# Altium project Baseboard-v2.1.PrjPcb (part 1 of 6)
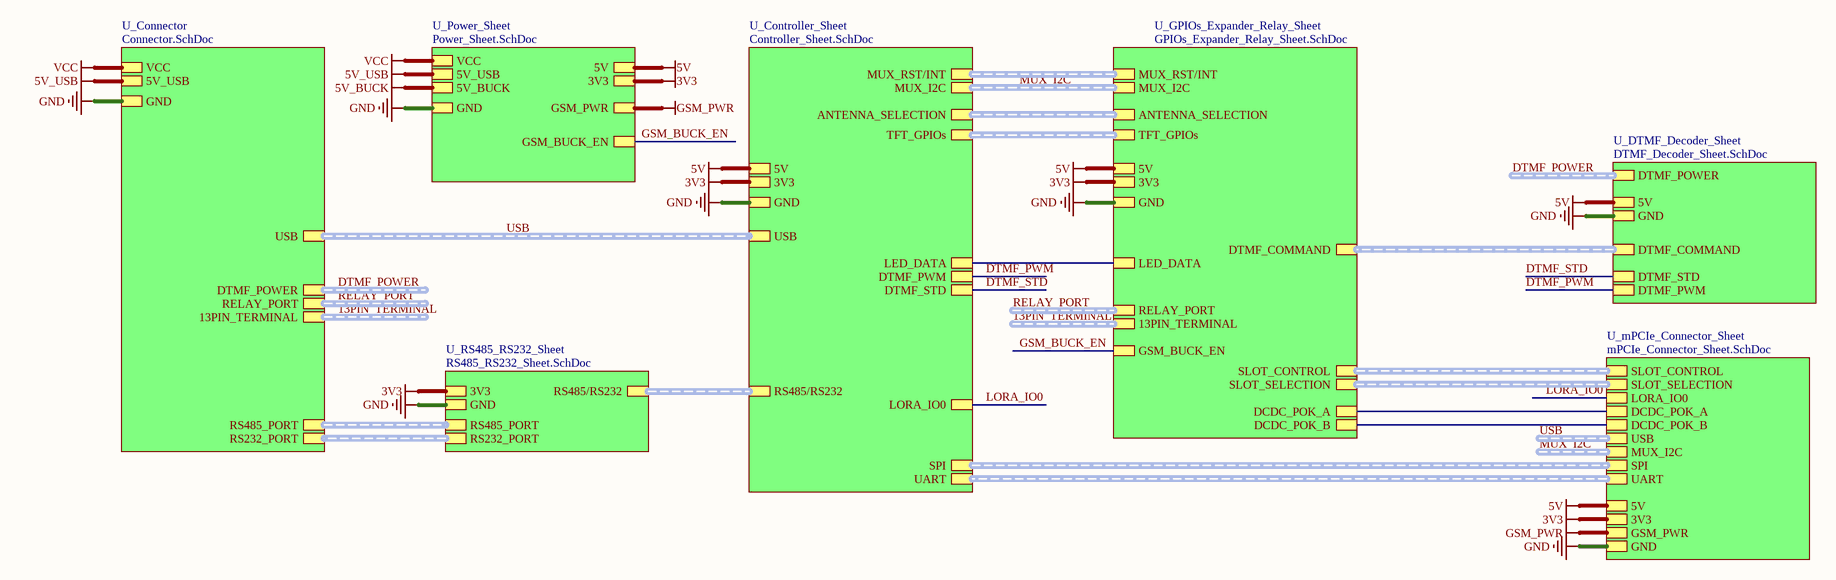
[diagram p0: Top_Sheet.SchDoc]
8 sheets, 216 parts. Net scope: hierarchical (ports join the sheet entries above them; power ports are global).
Board file: Baseboard-v2.0.PcbDoc
Sheets:
  Top_Sheet.SchDoc
    U_Connector = Connector.SchDoc
    U_Power_Sheet = Power_Sheet.SchDoc
    U_DTMF_Decoder_Sheet = DTMF_Decoder_Sheet.SchDoc
    U_RS485_RS232_Sheet = RS485_RS232_Sheet.SchDoc
    U_mPCIe_Connector_Sheet = mPCIe_Connector_Sheet.SchDoc
    U_Controller_Sheet = Controller_Sheet.SchDoc
    U_GPIOs_Expander_Relay_Sheet = GPIOs_Expander_Relay_Sheet.SchDoc

## Sheet Top_Sheet.SchDoc
size 420 x 297 mm; SheetNumber: 1; SheetTotal: 8

### Sub-sheets
U_Connector = Connector.SchDoc: VCC, GND, 5V_USB, RS485_PORT (harness RS485_PORT), DTMF_POWER (harness DTMF_POWER), RS232_PORT (harness RS232_PORT), RELAY_PORT (harness RELAY_PORT), 13PIN_TERMINAL (harness 17PIN_TERMINAL), USB (harness USB)
U_Controller_Sheet = Controller_Sheet.SchDoc: UART (harness UART), MUX_RST/INT (harness INTERRUPT), MUX_I2C (harness MUX_I2C), SPI (harness SPI), RS485/RS232 (harness RS485/RS232), USB (harness USB), DTMF_STD, GND, 5V, 3V3, ANTENNA_SELECTION (harness 17PIN_TERMINAL), LED_DATA, LORA_IO0, DTMF_PWM, TFT_GPIOs (harness 17PIN_TERMINAL)
U_DTMF_Decoder_Sheet = DTMF_Decoder_Sheet.SchDoc: DTMF_POWER (harness DTMF_POWER), 5V, GND, DTMF_COMMAND (harness DTMF_COMMAND), DTMF_STD, DTMF_PWM
U_GPIOs_Expander_Relay_Sheet = GPIOs_Expander_Relay_Sheet.SchDoc: 3V3, GND, 5V, DTMF_COMMAND (harness DTMF_COMMAND), RELAY_PORT (harness RELAY_PORT), 13PIN_TERMINAL (harness 17PIN_TERMINAL), SLOT_SELECTION (harness SLOT_SELECTION), MUX_RST/INT (harness INTERRUPT), MUX_I2C (harness MUX_I2C), DCDC_POK_A, SLOT_CONTROL (harness SLOT_CONTROL), ANTENNA_SELECTION (harness 17PIN_TERMINAL), LED_DATA, GSM_BUCK_EN, DCDC_POK_B, TFT_GPIOs (harness 17PIN_TERMINAL)
U_mPCIe_Connector_Sheet = mPCIe_Connector_Sheet.SchDoc: SLOT_SELECTION (harness SLOT_SELECTION), SLOT_CONTROL (harness SLOT_CONTROL), SPI (harness SPI), DCDC_POK_A, USB (harness USB), 5V, 3V3, MUX_I2C (harness MUX_I2C), GSM_PWR, GND, UART (harness UART), LORA_IO0, DCDC_POK_B
U_Power_Sheet = Power_Sheet.SchDoc: VCC, 5V_BUCK, GND, GSM_BUCK_EN, 5V_USB, GSM_PWR, 5V, 3V3
U_RS485_RS232_Sheet = RS485_RS232_Sheet.SchDoc: GND, RS485_PORT (harness RS485_PORT), RS232_PORT (harness RS232_PORT), 3V3, RS485/RS232 (harness RS485/RS232)

### Nets
3V3: sheet U_Power_Sheet/3V3, sheet U_RS485_RS232_Sheet/3V3, sheet U_mPCIe_Connector_Sheet/3V3, sheet U_Controller_Sheet/3V3, sheet U_GPIOs_Expander_Relay_Sheet/3V3
5V: sheet U_Power_Sheet/5V, sheet U_DTMF_Decoder_Sheet/5V, sheet U_mPCIe_Connector_Sheet/5V, sheet U_Controller_Sheet/5V, sheet U_GPIOs_Expander_Relay_Sheet/5V
5V_USB: sheet U_Connector/5V_USB, sheet U_Power_Sheet/5V_USB
GND: sheet U_Connector/GND, sheet U_Power_Sheet/GND, sheet U_DTMF_Decoder_Sheet/GND, sheet U_RS485_RS232_Sheet/GND, sheet U_mPCIe_Connector_Sheet/GND, sheet U_Controller_Sheet/GND, sheet U_GPIOs_Expander_Relay_Sheet/GND
GSM_PWR: sheet U_Power_Sheet/GSM_PWR, sheet U_mPCIe_Connector_Sheet/GSM_PWR
VCC: sheet U_Connector/VCC, sheet U_Power_Sheet/VCC
DCDC_POK_A: sheet U_mPCIe_Connector_Sheet/DCDC_POK_A, sheet U_GPIOs_Expander_Relay_Sheet/DCDC_POK_A
DCDC_POK_B: sheet U_mPCIe_Connector_Sheet/DCDC_POK_B, sheet U_GPIOs_Expander_Relay_Sheet/DCDC_POK_B
DTMF_PWM: sheet U_DTMF_Decoder_Sheet/DTMF_PWM, sheet U_Controller_Sheet/DTMF_PWM
DTMF_STD: sheet U_DTMF_Decoder_Sheet/DTMF_STD, sheet U_Controller_Sheet/DTMF_STD
GSM_BUCK_EN: sheet U_Power_Sheet/GSM_BUCK_EN, sheet U_GPIOs_Expander_Relay_Sheet/GSM_BUCK_EN
LED_DATA: sheet U_Controller_Sheet/LED_DATA, sheet U_GPIOs_Expander_Relay_Sheet/LED_DATA
LORA_IO0: sheet U_mPCIe_Connector_Sheet/LORA_IO0, sheet U_Controller_Sheet/LORA_IO0

### Buses and harness runs
harness 13PIN_TERMINAL = sheet U_Connector/13PIN_TERMINAL
harness 13PIN_TERMINAL = sheet U_GPIOs_Expander_Relay_Sheet/13PIN_TERMINAL
harness DTMF_POWER = sheet U_Connector/DTMF_POWER
harness DTMF_POWER = sheet U_DTMF_Decoder_Sheet/DTMF_POWER
harness MUX_I2C = sheet U_Controller_Sheet/MUX_I2C = sheet U_GPIOs_Expander_Relay_Sheet/MUX_I2C
harness MUX_I2C = sheet U_mPCIe_Connector_Sheet/MUX_I2C
harness RELAY_PORT = sheet U_Connector/RELAY_PORT
harness RELAY_PORT = sheet U_GPIOs_Expander_Relay_Sheet/RELAY_PORT
harness sheet U_Connector/RS232_PORT = sheet U_RS485_RS232_Sheet/RS232_PORT
harness sheet U_Connector/RS485_PORT = sheet U_RS485_RS232_Sheet/RS485_PORT
harness sheet U_Controller_Sheet/ANTENNA_SELECTION = sheet U_GPIOs_Expander_Relay_Sheet/ANTENNA_SELECTION
harness sheet U_Controller_Sheet/MUX_RST/INT = sheet U_GPIOs_Expander_Relay_Sheet/MUX_RST/INT
harness sheet U_Controller_Sheet/RS485/RS232 = sheet U_RS485_RS232_Sheet/RS485/RS232
harness sheet U_Controller_Sheet/SPI = sheet U_mPCIe_Connector_Sheet/SPI
harness sheet U_Controller_Sheet/TFT_GPIOs = sheet U_GPIOs_Expander_Relay_Sheet/TFT_GPIOs
harness sheet U_Controller_Sheet/UART = sheet U_mPCIe_Connector_Sheet/UART
harness sheet U_DTMF_Decoder_Sheet/DTMF_COMMAND = sheet U_GPIOs_Expander_Relay_Sheet/DTMF_COMMAND
harness sheet U_GPIOs_Expander_Relay_Sheet/SLOT_CONTROL = sheet U_mPCIe_Connector_Sheet/SLOT_CONTROL
harness sheet U_GPIOs_Expander_Relay_Sheet/SLOT_SELECTION = sheet U_mPCIe_Connector_Sheet/SLOT_SELECTION
harness USB = sheet U_Connector/USB = sheet U_Controller_Sheet/USB
harness USB = sheet U_mPCIe_Connector_Sheet/USB

### Notes on the sheet
- File:
- Title:
- Date:
- Page
- Num:
- Total:
- Drawn By: Huzaifa Ali

## Sheet Connector.SchDoc
size A4; SheetNumber: 2; SheetTotal: 8
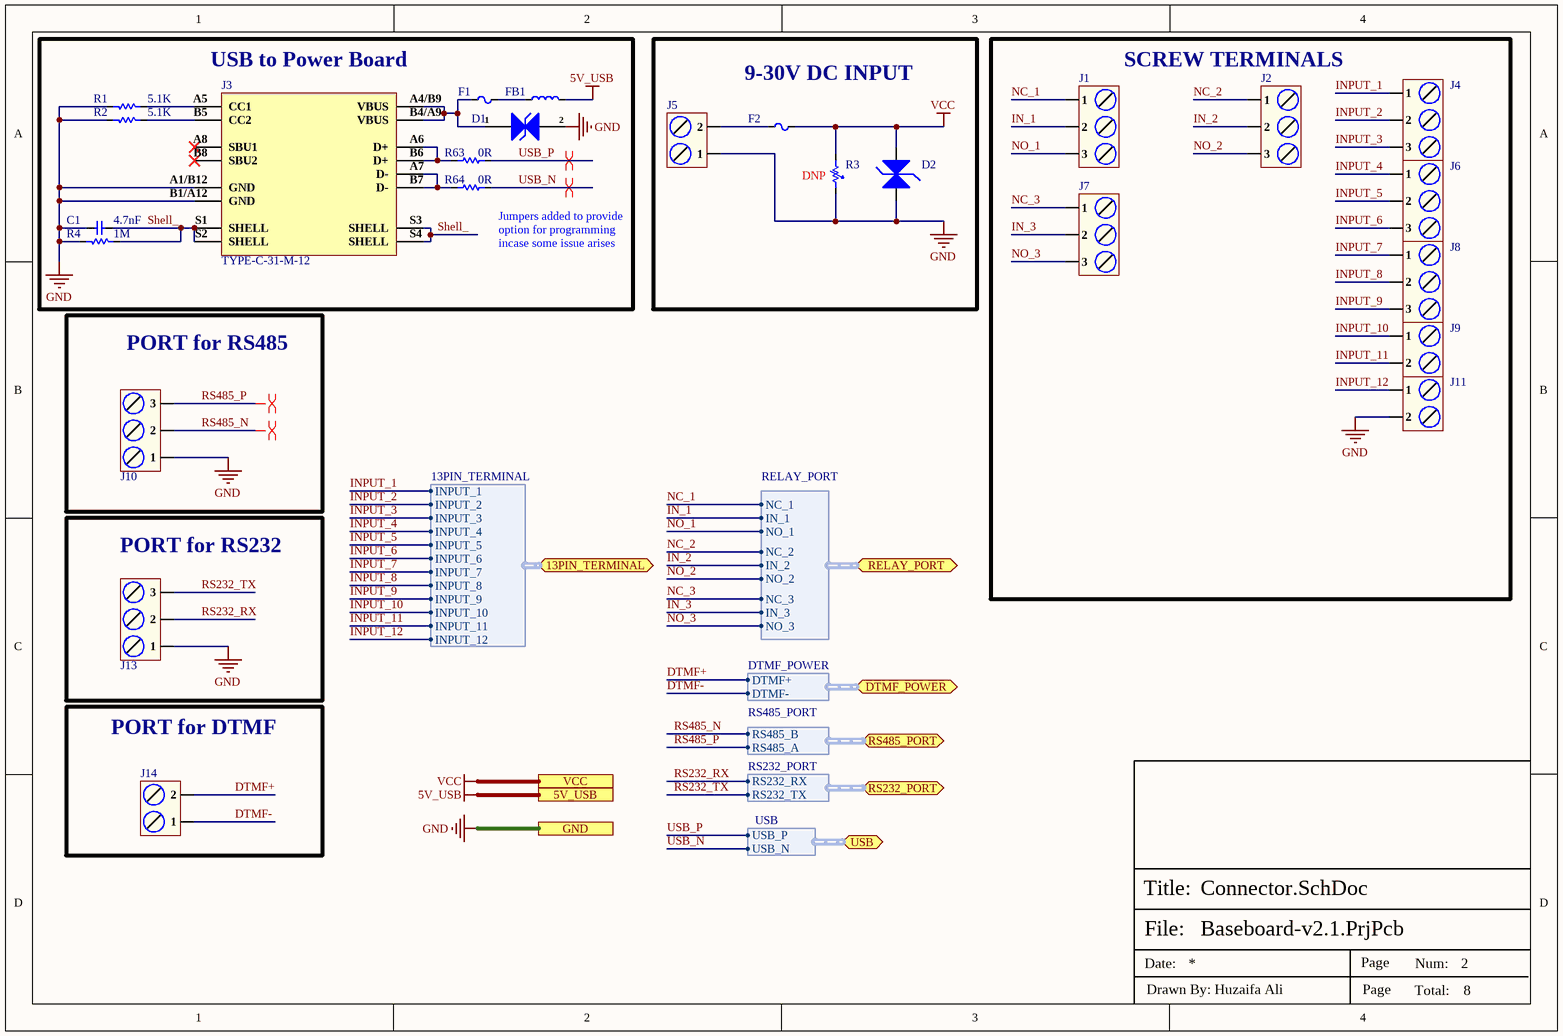
[diagram p1: Connector.SchDoc]

### Parts
C1  4.7nF  [Cap-0603]
D1  PESD5V0H1BSFYL  [DSN0603-2]  (value not drawn)
D2  SMBJ36CA  [SMB_]  (value not drawn)
F1  1206L300SLTHYR  [Fuse 1206 (3216 Metric)]  (value not drawn)
F2  SHV2920P500-30-AA  [Fuse-2920]  (value not drawn)
FB1  100MHz  [IND-1206]  (value not drawn)
J1  DB128L-5.08-3P-BK-S  [DB128L-5.08-3P-BK-S]  (value not drawn)
J2  DB128L-5.08-3P-BK-S  [DB128L-5.08-3P-BK-S]  (value not drawn)
J3  TYPE-C-31-M-12  [TYPE-C-31-M-12_]
J4  DB128L-5.08-3P-BK-S  [DB128L-5.08-3P-BK-S]  (value not drawn)
J5  DB128L-5.08-2P-BK-S  [DB128L-5.08-2P-BK-S]  (value not drawn)
J6  DB128L-5.08-3P-BK-S  [DB128L-5.08-3P-BK-S]  (value not drawn)
J7  DB128L-5.08-3P-BK-S  [DB128L-5.08-3P-BK-S]  (value not drawn)
J8  DB128L-5.08-3P-BK-S  [DB128L-5.08-3P-BK-S]  (value not drawn)
J9  DB128L-5.08-2P-BK-S  [DB128L-5.08-2P-BK-S]  (value not drawn)
J10  DB128L-5.08-3P-BK-S  [DB128L-5.08-3P-BK-S]  (value not drawn)
J11  DB128L-5.08-2P-BK-S  [DB128L-5.08-2P-BK-S]  (value not drawn)
J13  DB128L-5.08-3P-BK-S  [DB128L-5.08-3P-BK-S]  (value not drawn)
J14  DB128L-5.08-2P-BK-S  [DB128L-5.08-2P-BK-S]  (value not drawn)
R1  5.1K  [Res-0402]
R2  5.1K  [Res-0402]
R3  B72210S0300K101  [B72210S0300K101]  (value not drawn)
R4  1M  [Res-0402]
R63  0R  [Res-0402]
R64  0R  [Res-0402]

### Blocks framed on the sheet
USB to Power Board: C1 D1 F1 FB1 J3 R1 R2 R4 R63 R64
9-30V DC INPUT: D2 F2 J5 R3
SCREW TERMINALS: J1 J2 J4 J6-J9 J11
PORT for RS485: J10
PORT for RS232: J13
PORT for DTMF: J14

### Ports
5V_USB, 13PIN_TERMINAL (bidir, harness 13PIN_TERMINAL), DTMF_POWER (bidir, harness DTMF_POWER), GND, RELAY_PORT (bidir, harness RELAY_PORT), RS232_PORT (bidir, harness RS232_PORT), RS485_PORT (bidir, harness RS485_PORT), USB (bidir, harness USB), VCC

### Harnesses
RS485_PORT: RS485_B, RS485_A
DTMF_POWER: DTMF+, DTMF-
RS232_PORT: RS232_RX, RS232_TX
RELAY_PORT: NC_1, NC_2, IN_1, IN_2, NO_1, NO_2, NC_3, IN_3, NO_3
USB: USB_P, USB_N
13PIN_TERMINAL: INPUT_7, INPUT_1, INPUT_2, INPUT_8, INPUT_3, INPUT_9, INPUT_4, INPUT_10, INPUT_5, INPUT_11, INPUT_6, INPUT_12

### Nets
5V_USB: FB1.2 ; port 5V_USB
GND: C1.1 D1.2 D2.1(A) J3.A1/B12(GND) J3.B1/A12(GND) J5.1 J10.1 J11.2 J13.1 R1.2 R2.2 R3.2 R4.2 ; port GND
VCC: D2.2(A) F2.2 R3.1 ; port VCC
DTMF+: J14.2 ; port DTMF_POWER.DTMF+
DTMF-: J14.1 ; port DTMF_POWER.DTMF-
IN_1: J1.2 ; port RELAY_PORT.IN_1
IN_2: J2.2 ; port RELAY_PORT.IN_2
IN_3: J7.2 ; port RELAY_PORT.IN_3
INPUT_1: J4.1 ; port 13PIN_TERMINAL.INPUT_1  [project net 13PIN_TERMINAL.INPUT_1]
INPUT_2: J4.2 ; port 13PIN_TERMINAL.INPUT_2  [project net 13PIN_TERMINAL.INPUT_2]
INPUT_3: J4.3 ; port 13PIN_TERMINAL.INPUT_3  [project net 13PIN_TERMINAL.INPUT_3]
INPUT_4: J6.1 ; port 13PIN_TERMINAL.INPUT_4  [project net 13PIN_TERMINAL.INPUT_4]
INPUT_5: J6.2 ; port 13PIN_TERMINAL.INPUT_5  [project net 13PIN_TERMINAL.INPUT_5]
INPUT_6: J6.3 ; port 13PIN_TERMINAL.INPUT_6  [project net 13PIN_TERMINAL.INPUT_6]
INPUT_7: J8.1 ; port 13PIN_TERMINAL.INPUT_7  [project net 13PIN_TERMINAL.INPUT_7]
INPUT_8: J8.2 ; port 13PIN_TERMINAL.INPUT_8  [project net 13PIN_TERMINAL.INPUT_8]
INPUT_9: J8.3 ; port 13PIN_TERMINAL.INPUT_9  [project net 13PIN_TERMINAL.INPUT_9]
INPUT_10: J9.1 ; port 13PIN_TERMINAL.INPUT_10  [project net 13PIN_TERMINAL.INPUT_10]
INPUT_11: J9.2 ; port 13PIN_TERMINAL.INPUT_11  [project net 13PIN_TERMINAL.INPUT_11]
INPUT_12: J11.1 ; port 13PIN_TERMINAL.INPUT_12  [project net 13PIN_TERMINAL.INPUT_12]
NC_1: J1.1 ; port RELAY_PORT.NC_1
NC_2: J2.1 ; port RELAY_PORT.NC_2
NC_3: J7.1 ; port RELAY_PORT.NC_3
NO_1: J1.3 ; port RELAY_PORT.NO_1
NO_2: J2.3 ; port RELAY_PORT.NO_2
NO_3: J7.3 ; port RELAY_PORT.NO_3
RS232_RX: J13.2 ; port RS232_PORT.RS232_RX
RS232_TX: J13.3 ; port RS232_PORT.RS232_TX
RS485_N: J10.2 ; port RS485_PORT.RS485_B
RS485_P: J10.3 ; port RS485_PORT.RS485_A
Shell_: C1.2 J3.S1(SHELL) J3.S2(SHELL) J3.S3(SHELL) J3.S4(SHELL) R4.1
USB_N: R64.2 ; port USB.USB_N  [project net USB.USB_N]
USB_P: R63.2 ; port USB.USB_P  [project net USB.USB_P]
NetD1_1: D1.1 F1.1 J3.A4/B9(VBUS) J3.B4/A9(VBUS)
NetF1_2: F1.2 FB1.1
NetF2_1: F2.1 J5.2
NetJ3_A5: J3.A5(CC1) R1.1
NetJ3_A6: J3.A6(D+) J3.B6(D+) R63.1
NetJ3_A7: J3.A7(D-) J3.B7(D-) R64.1
NetJ3_B5: J3.B5(CC2) R2.1

Not connected (* = marked no-connect by the designer): J3 A8(SBU1)* B8(SBU2)*

### Layout directives
differential pair; net class RS485; differential pair class RS485_LINES; rule Impedance Constraint [Min = 115.0    Max = 120.0    ]; rule Matched Net Lengths [Tolerance = 0.508mm]: RS485_N, RS485_P, USB.USB_N, USB.USB_P

### Notes on the sheet
- (near R3) DNP
- (near R64) Jumpers added to provide option for programming incase some issue arises
- File:
- Title:
- Date:
- Page
- Num:
- Total:
- Drawn By: Huzaifa Ali

### Library data of the parts
C1 = CC0603JRNPO9BN472: CAP CER 4700PF 50V C0G/NPO 0603; Manufacturer: Yageo; Item Type: Capacitor; Supplier 1: Digi-Key; Manufacturer Part Number: CC0603JRNPO9BN472; RoHS: Yes; Category: Ceramic Capacitors; Stock 1: 31779; Pricing 1: 1=0.48000, 10=0.33000, 50=0.23100, 100=0.19800, 500=0.14854, 1000=0.12543 (USD); RoHS Compliant: Yes; Supplier Part Number 1: 13-CC0603JRNPO9BN472CT-ND; LCSC Part Number: C576818; ComponentLink1Description: LCSC; ComponentLink1URL: https://www.lcsc.com/product-detail/Multilayer-Ceramic-Capacitors-MLCC-SMD-SMT_YAGEO-CC0603JRNPO9BN472_C576818.html
D1 = PESD5V0H1BSFYL: TVS DIODE 5VWM 6.3VC DSN0603-2; Manufacturer: Nexperia; Supplier 1: Avnet; Manufacturer Part Number: PESD5V0H1BSFYL; RoHS: Yes; Category: ESD and Circuit Protection ICs; Stock 1: 9000; Pricing 1: 18000=0.06453, 36000=0.06278, 54000=0.06104, 90000=0.05930, 180000=0.05755, 900000=0.05581, 1800000=0.05406 (USD); RoHS Compliant: Yes; ComponentLink1URL: http://www.farnell.com/datasheets/1961312.pdf?src-supplier=Farnell; ComponentLink1Description: http://www.farnell.com/datasheets/1961312.pdf?src-supplier=Farnell; ComponentLink2URL: https://assets.nexperia.com/documents/data-sheet/PESD5V0H1BSF.pdf?src-supplier=Digi-Key; ComponentLink2Description: https://assets.nexperia.com/documents/data-sheet/PESD5V0H1BSF.pdf?src-supplier=Digi-Key; ComponentLink3URL: http://www.farnell.com/datasheets/1961312.pdf?src-supplier=Newark; ComponentLink3Description: http://www.farnell.com/datasheets/1961312.pdf?src-supplier=Newark; Supplier Part Number 1: PESD5V0H1BSFYL; LCSC Part Number: C477989; Item Type: Diode
D2 = SMBJ36CA: 58.1V 40V 36V Bi-Directional SMB(DO-214AA) TVS ROHS; Manufacturer: Slkor(SLKORMICRO Elec.); Item Type: Diode; Manufacturer Part Number: SMBJ36CA; Package: SMB(DO-214AA); LCSC Part Number: C556189; ComponentLink1Description: LCSC; ComponentLink1URL: https://www.lcsc.com/product-detail/span-style-background-color-ff0-TVS-span_Slkor-SLKORMICRO-Elec-SMBJ36CA_C556189.html
F1 = 1206L300SLTHYR: PTC RESET FUSE 6V 3A 1206; Manufacturer: Littelfuse; Max Current Rating: 50A; Resistance: 20mR; Power Dissipation: 800mW; Trip Current: 6A; Time to Trip: 4s; Approvals: UL,TUV; Supplier 1: Arrow Electronics; Manufacturer Part Number: 1206L300SLTHYR; RoHS: Yes; Category: PTC Resettable Fuses; Stock 1: 4000; Pricing 1: 4000=0.60290 (USD); Case/Package: 1206; Case Code (Metric): 3216; Case Code (Imperial): 1206; Min Operating Temperature: -40°C; Max Operating Temperature: 85°C; Package Quantity: 4000; Packaging: Tape and Reel; Termination: SMD/SMT; Max Voltage Rating (DC): 6V; Hold Current: 3A; Voltage Rating (DC): 6V; Operating Supply Voltage: 6V; Series: POLY-FUSE®, LoRho™; Lead Free: Lead Free; RoHS Compliant: Yes; ComponentLink1URL: https://datasheet.ciiva.com/7438/littelfuse-lorho-ptc-7438567.pdf?src-supplier=Digi-Key; ComponentLink1Description: https://datasheet.ciiva.com/7438/littelfuse-lorho-ptc-7438567.pdf?src-supplier=Digi-Key; ComponentLink2URL: https://datasheet.ciiva.com/7438/littelfuse-lorho-ptc-7438569.pdf?src-supplier=Digi-Key; ComponentLink2Description: https://datasheet.ciiva.com/7438/littelfuse-lorho-ptc-7438569.pdf?src-supplier=Digi-Key; ComponentLink3URL: https://datasheet.ciiva.com/7438/littelfuse-lorho-ptc-7438565.pdf?src-supplier=Digi-Key; ComponentLink3Description: https://datasheet.ciiva.com/7438/littelfuse-lorho-ptc-7438565.pdf?src-supplier=Digi-Key; Supplier Part Number 1: 1206L300SLTHYR; LCSC Part Number: C207041; Item Type: Fuse
F2 = SHV2920P500-30-AA: 30V 5A 5A 2920 Resettable Fuses ROHS; Manufacturer: PTTC(Polytronics Tech); Item Type: Fuse; ComponentLink1Description: LCSC; ComponentLink1URL: https://www.lcsc.com/product-detail/Resettable-Fuses_PTTC-Polytronics-Tech-SHV2920P500-30-AA_C495350.html; Manufacturer Part Number: SHV2920P500-30-AA; Package: 2920; LCSC Part Number: C495350
FB1 = BLM31PG121SN1L: FERRITE BEAD 120 OHM 1206 1LN; Manufacturer: Murata; Material: Steel,Ferrite; Tolerance: 25%; Impedance: 120R; Max Current Rating: 3.5A; Number of Lines: 1; DC Resistance (DCR): 20mR; Max DC Current: 3A; Shielding: Unshielded; Supplier 1: Avnet; Manufacturer Part Number: BLM31PG121SN1L; RoHS: Yes; Category: Ferrite Beads and Chips; Stock 1: 290640; Pricing 1: 3000=0.11563, 6000=0.10938, 12000=0.10313, 18000=0.09688, 24000=0.09063, 30000=0.08438, 300000=0.07813 (USD); Case/Package: 1206; Number of Pins: 2; Core Material: Ferrite; Case Code (Metric): 3216; Case Code (Imperial): 1206; Contact Plating: Tin,Matte; Min Operating Temperature: -55°C; Max Operating Temperature: 125°C; Package Quantity: 3000; Packaging: Tape and Reel; Current Rating: 3.5A; Termination: SMD/SMT; Test Frequency: 100MHz; DC Current: 3A; Frequency: 100MHz; Length: 3.2mm; Width: 1.6mm; Height: 1.1mm; Depth: 1.6mm; Radiation Hardening: No; Military Standard: Not; Lead Free: Lead Free; RoHS Compliant: Yes; ComponentLink1URL: https://datasheet.ciiva.com/19460/1845419-19460234.pdf?src-supplier=Jameco; ComponentLink1Description: https://datasheet.ciiva.com/19460/1845419-19460234.pdf?src-supplier=Jameco; ComponentLink2URL: https://datasheet.ciiva.com/1012/l0132s0193blm31p-1012992.pdf?src-supplier=Digi-Key; ComponentLink2Description: https://datasheet.ciiva.com/1012/l0132s0193blm31p-1012992.pdf?src-supplier=Digi-Key; ComponentLink3URL: https://datasheet.ciiva.com/11799/0900766b811b5866-11799444.pdf?src-supplier=RSComponents; ComponentLink3Description: https://datasheet.ciiva.com/11799/0900766b811b5866-11799444.pdf?src-supplier=RSComponents; ComponentLink4URL: https://datasheet.ciiva.com/3081/l0110s0100blm31p-3081665.pdf?src-supplier=Avnet; ComponentLink4Description: https://datasheet.ciiva.com/3081/l0110s0100blm31p-3081665.pdf?src-supplier=Avnet; ComponentLink5URL: https://datasheet.ciiva.com/41449/001172383-da-01-en-drossel-1206-120r-3-2x1-60mm-3000st-41449554.pdf?src-supplier=Conrad; ComponentLink5Description: https://datasheet.ciiva.com/41449/001172383-da-01-en-drossel-1206-120r-3-2x1-60mm-3000st-41449554.pdf?src-supplier=Conrad; ComponentLink6URL: https://datasheet.ciiva.com/29348/442557-da-01-en-chip-drossel-1206-120r-3000ma-3-2x1-60mm-29348014.pdf?src-supplier=Conrad; ComponentLink6Description: https://datasheet.ciiva.com/29348/442557-da-01-en-chip-drossel-1206-120r-3000ma-3-2x1-60mm-29348014.pdf?src-supplier=Conrad; ComponentLink7URL: https://datasheet.ciiva.com/14122/apblm31p-data-e-14122856.pdf?src-supplier=Distrelec; ComponentLink7Description: https://datasheet.ciiva.com/14122/apblm31p-data-e-14122856.pdf?src-supplier=Distrelec; ComponentLink8URL: https://datasheet.ciiva.com/48436/blm31pg121sn1l-eng-tds-48436731.pdf?src-supplier=Distrelec; ComponentLink8Description: https://datasheet.ciiva.com/48436/blm31pg121sn1l-eng-tds-48436731.pdf?src-supplier=Distrelec; ComponentLink9URL: https://datasheet.ciiva.com/1012/l0110s0100blm31p-1012991.pdf?src-supplier=Digi-Key; ComponentLink9Description: https://datasheet.ciiva.com/1012/l0110s0100blm31p-1012991.pdf?src-supplier=Digi-Key; ComponentLink10URL: https://datasheet.ciiva.com/1012/l0110s0100blm31p-1012993.pdf?src-supplier=Digi-Key; ComponentLink10Description: https://datasheet.ciiva.com/1012/l0110s0100blm31p-1012993.pdf?src-supplier=Digi-Key; ComponentLink11URL: https://datasheet.ciiva.com/3081/l0110s0100blm31p-3081666.pdf?src-supplier=Avnet; ComponentLink11Description: https://datasheet.ciiva.com/3081/l0110s0100blm31p-3081666.pdf?src-supplier=Avnet; ComponentLink12URL: https://datasheet.ciiva.com/16390/l0110s0100blm31p-16390857.pdf?src-supplier=Future+Electronics; ComponentLink12Description: https://datasheet.ciiva.com/16390/l0110s0100blm31p-16390857.pdf?src-supplier=Future+Electronics; ComponentLink13URL: https://datasheet.ciiva.com/18093/getdatasheetpartid-152966-18093084.pdf?src-supplier=Verical; ComponentLink13Description: https://datasheet.ciiva.com/18093/getdatasheetpartid-152966-18093084.pdf?src-supplier=Verical; Supplier Part Number 1: BLM31PG121SN1L; LCSC Part Number: C85841; Item Type: Ferrite Bead
J1 J2 J4 J6-J8 J10 J13 = DB128L-5.08-3P-BK-S: 1x3P 18A -40℃~+105℃ 250V Black 12~30 Straight pin 5.08mm 2.5 1 3 Plugin,P=5.08mm Screw terminal ROHS; Manufacturer: DIBO; Item Type: Terminal Block; Manufacturer Part Number: DB128L-5.08-3P-BK-S; Package: Plugin,P=5.08mm; LCSC Part Number: C430602; ComponentLink1Description: LCSC; ComponentLink1URL: https://www.lcsc.com/product-detail/Screw-terminal_DIBO-DB128L-5-08-3P-BK-S_C430602.html
J3 = TYPE-C-31-M-12: 250mA 1 16 Female Type-C SMD USB Connectors ROHS; Manufacturer: Korean Hroparts Elec; ComponentLink1Description: LCSC; ComponentLink1URL: https://www.lcsc.com/product-detail/USB-Connectors_Korean-Hroparts-Elec-TYPE-C-31-M-12_C165948.html; Manufacturer Part Number: TYPE-C-31-M-12; Footprint: Custom; LCSC Part Number: C165948; Item Type: USB Connector
J5 J9 J11 J14 = DB128L-5.08-2P-BK-S: 1x2P 18A -40℃~+105℃ 250V Black 12~30 Straight pin 5.08mm 2.5 1 2 Plugin,P=5.08mm Screw terminal ROHS; Manufacturer: DIBO; Item Type: Terminal Block; Manufacturer Part Number: DB128L-5.08-2P-BK-S; Package: Plugin,P=5.08mm; LCSC Part Number: C430601; ComponentLink1Description: LCSC; ComponentLink1URL: https://www.lcsc.com/product-detail/Screw-terminal_span-style-background-color-ff0-DIBO-span-DB128L-5-08-2P-BK-S_C430601.html
R1 R2 = ERJ-PA2F5101X: RES SMD 5.1 KOHM 1% 1/5W 0402; Manufacturer: Panasonic; Item Type: Resistor; Supplier 1: Digi-Key; Manufacturer Part Number: ERJ-PA2F5101X; Stock 1: 5235; Pricing 1: 1=0.22, 10=0.183, 100=0.0717, 1000=0.03002, 2500=0.02751, 5000=0.02501 (USD); Supplier Part Number 1: P124488DKR-ND; LCSC Part Number: *
R3 = B72210S0300K101: VARISTOR 47V 500A DISC 10MM; Manufacturer: TDK EPCOS; Voltage Rating (DC): 38V; Voltage Rating (AC): 30V; Value: 2.75nF; Clamping Voltage: 93V; Clamping Current: 5A; Energy: 4.4J; Lead/Base Style: Radial; Tolerance: 10%; Number of Circuits: 1; Min Varistor Voltage: 42.3V; Max Varistor Voltage: 51.7V; Lead Length: 30mm; Supplier 1: Arrow Electronics; Manufacturer Part Number: B72210S0300K101; RoHS: Yes; Category: Varistors; Stock 1: 14838; Pricing 1: 1=0.3862, 10=0.3035, 25=0.3004, 100=0.2152, 250=0.215, 500=0.1646, 1000=0.1301, 2500=0.1213, 5000=0.1048 (USD); Mounting Technology: Through Hole,Radial; Min Operating Temperature: -40°C; Max Operating Temperature: 85°C; Max Surge Current: 500A; Packaging: Bulk; Max Voltage Rating (DC): 38V; Max Voltage Rating (AC): 30V; Varistor Voltage: 47V; Series: Standard; Package Quantity: 500; Diameter: 10mm; Lead Pitch: 7.5mm; Depth: 4.4mm; Thickness: 4.4mm; Reach SVHC Compliant: No; RoHS Compliant: Yes; ComponentLink1URL: https://datasheet.ciiva.com/11834/0900766b80188ddb-11834267.pdf?src-supplier=Rs; ComponentLink1Description: https://datasheet.ciiva.com/11834/0900766b80188ddb-11834267.pdf?src-supplier=Rs; ComponentLink2URL: https://datasheet.ciiva.com/15155/getdatasheetpartid-111496-15155493.pdf?src-supplier=Verical; ComponentLink2Description: https://datasheet.ciiva.com/15155/getdatasheetpartid-111496-15155493.pdf?src-supplier=Verical; ComponentLink3URL: https://datasheet.ciiva.com/1277/1899727-1277935.pdf?src-supplier=Element14; ComponentLink3Description: https://datasheet.ciiva.com/1277/1899727-1277935.pdf?src-supplier=Element14; Supplier Part Number 1: B72210S0300K101; LCSC Part Number: C125513; Item Type: Varistor
R4 = AF0402JR-071ML: RES SMD 1M OHM 5% 1/16W 0402; Manufacturer: Yageo; Resistance: 1MR; Max Power Dissipation: 63mW; Temperature Coefficient: 100ppm/°C; Item Type: Resistor; Supplier 1: Digi-Key; Manufacturer Part Number: AF0402JR-071ML; Stock 1: 0; Pricing 1: 10000=0.00408 (USD); Case/Package: 0402; Min Operating Temperature: -55°C; Max Operating Temperature: 155°C; Packaging: Tape and Reel; Resistor Type: Thick Film; Number of Terminations: 2; Tolerance: 5%; Features: Moisture Resistant,Anti-Sulfur; Length: 0.039inch; Width: 0.02inch; Height: 0.015inch; RoHS Compliant: Yes; ComponentLink1URL: https://www.yageo.com/upload/media/product/productsearch/datasheet/rchip/PYu-AF_51_RoHS_L_6.pdf?src-supplier=Digi-Key; ComponentLink1Description: https://www.yageo.com/upload/media/product/productsearch/datasheet/rchip/PYu-AF_51_RoHS_L_6.pdf?src-supplier=Digi-Key; Supplier Part Number 1: AF0402JR-071ML-ND; LCSC Part Number: C144054
R63 R64 = RC0402FR-070RL: RES 0 OHM JUMPER 1/16W 0402; Manufacturer: Yageo; Tolerance: 1%; Power Rating: 62.5mW; Voltage Rating: 50V; Temperature Coefficient: 200ppm/°C; Max Power Dissipation: 63mW; Supplier 1: Mouser; Manufacturer Part Number: RC0402FR-070RL; RoHS: Yes; Category: Chip SMD Resistors; Stock 1: 8556842; Pricing 1: 1=0.10000, 10=0.01400, 50=0.01400, 100=0.00600, 1000=0.00300, 5000=0.00200, 10000=0.00100 (USD); Mount: Surface Mount; Case/Package: 0402; Contact Plating: Tin,Matte; Case Code (Imperial): 0402; Case Code (Metric): 1005; Size Code: 0402; Min Operating Temperature: -55°C; Max Operating Temperature: 155°C; Resistance: 0R; Resistor Type: Thick Film; Packaging: Tape and Reel; Termination: SMD/SMT; Features: Moisture Resistant; Series: RC; Number of Terminations: 2; Length: 1mm; Width: 0.5mm; Height: 0.35mm; Radiation Hardening: No; Lead Free: Lead Free; RoHS Compliant: Yes; ComponentLink1URL: https://datasheet.ciiva.com/8896/pyu-rc0402-51-rohs-l-6-8896149.pdf?src-supplier=Avnet; ComponentLink1Description: https://datasheet.ciiva.com/8896/pyu-rc0402-51-rohs-l-6-8896149.pdf?src-supplier=Avnet; ComponentLink2URL: https://datasheet.ciiva.com/16790/pyu-rc0402-51-rohs-l-6-r-16790444.pdf?src-supplier=Future+Electronics; ComponentLink2Description: https://datasheet.ciiva.com/16790/pyu-rc0402-51-rohs-l-6-r-16790444.pdf?src-supplier=Future+Electronics; Supplier Part Number 1: 603-RC0402FR-070RL; LCSC Part Number: C106231